# Altium project PCB.PrjPcb
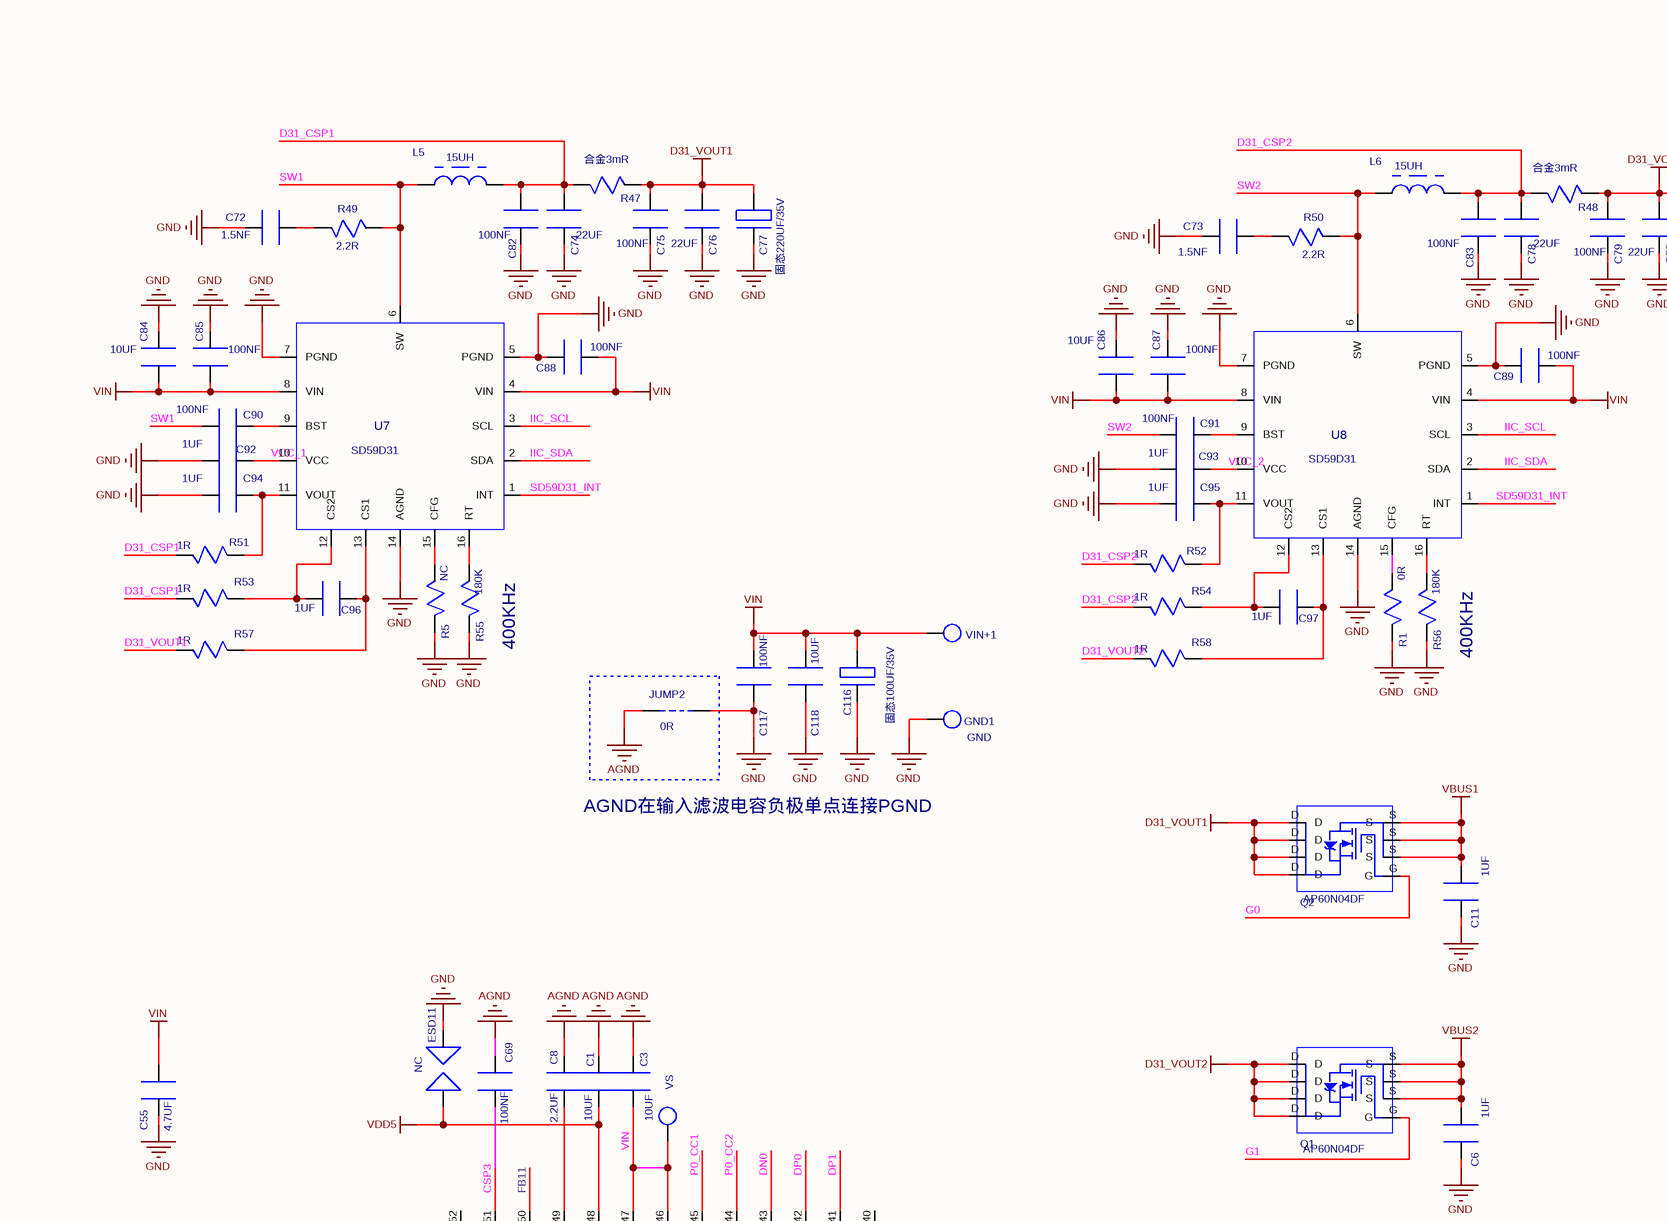
[diagram p0: K210-01-(B049) 3C1A-140W(SD3934+SD59D31+SD59D31+SP1232FL) 外挂FTF屏1.3寸-V3.SchDoc, top left]
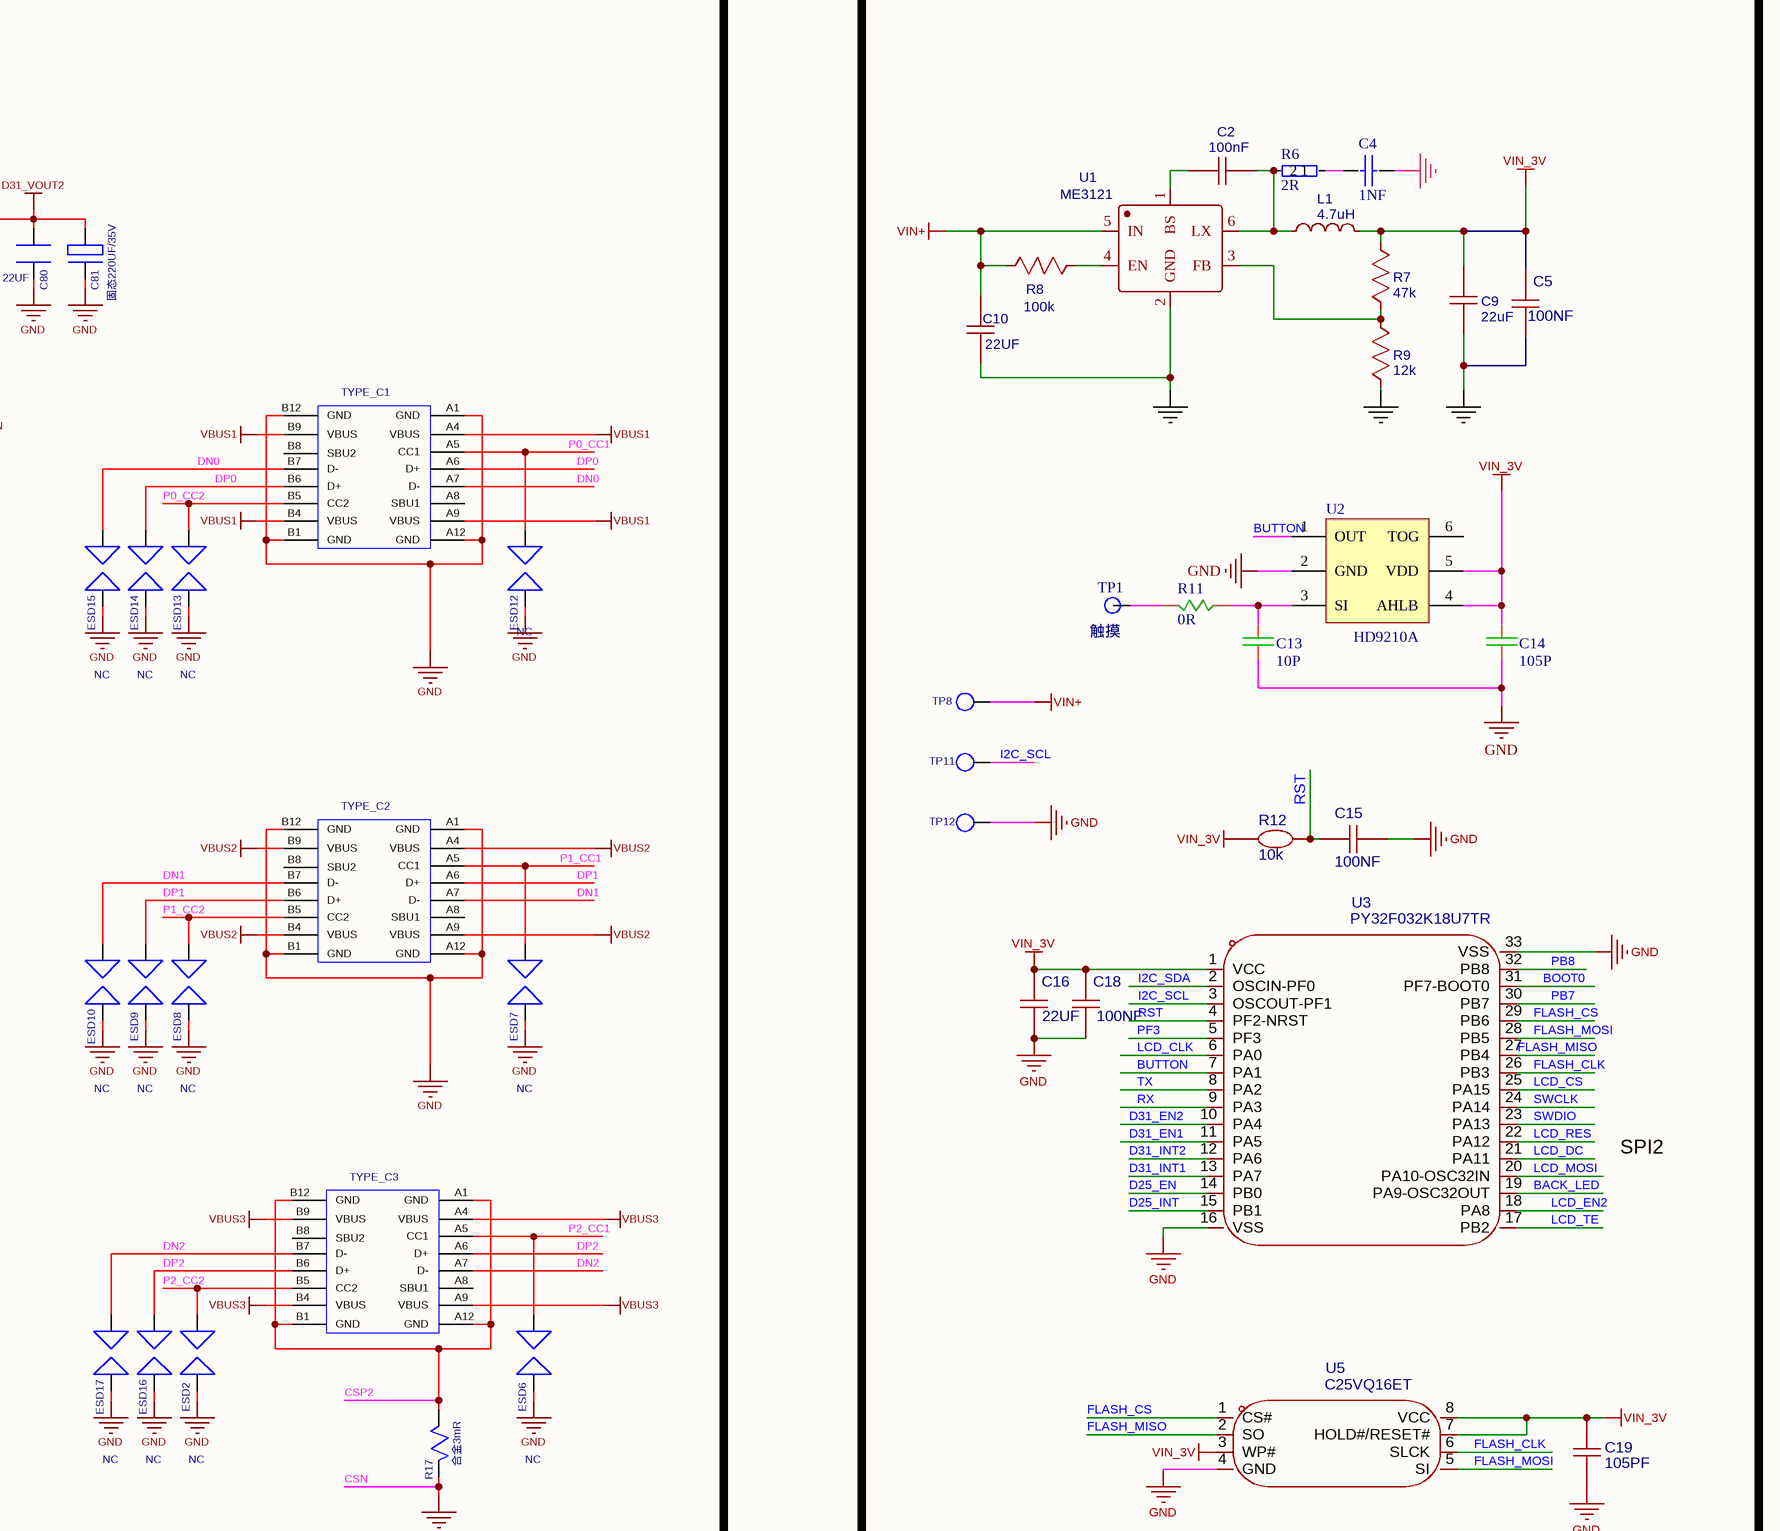
[diagram p1: K210-01-(B049) 3C1A-140W(SD3934+SD59D31+SD59D31+SP1232FL) 外挂FTF屏1.3寸-V3.SchDoc, top right]
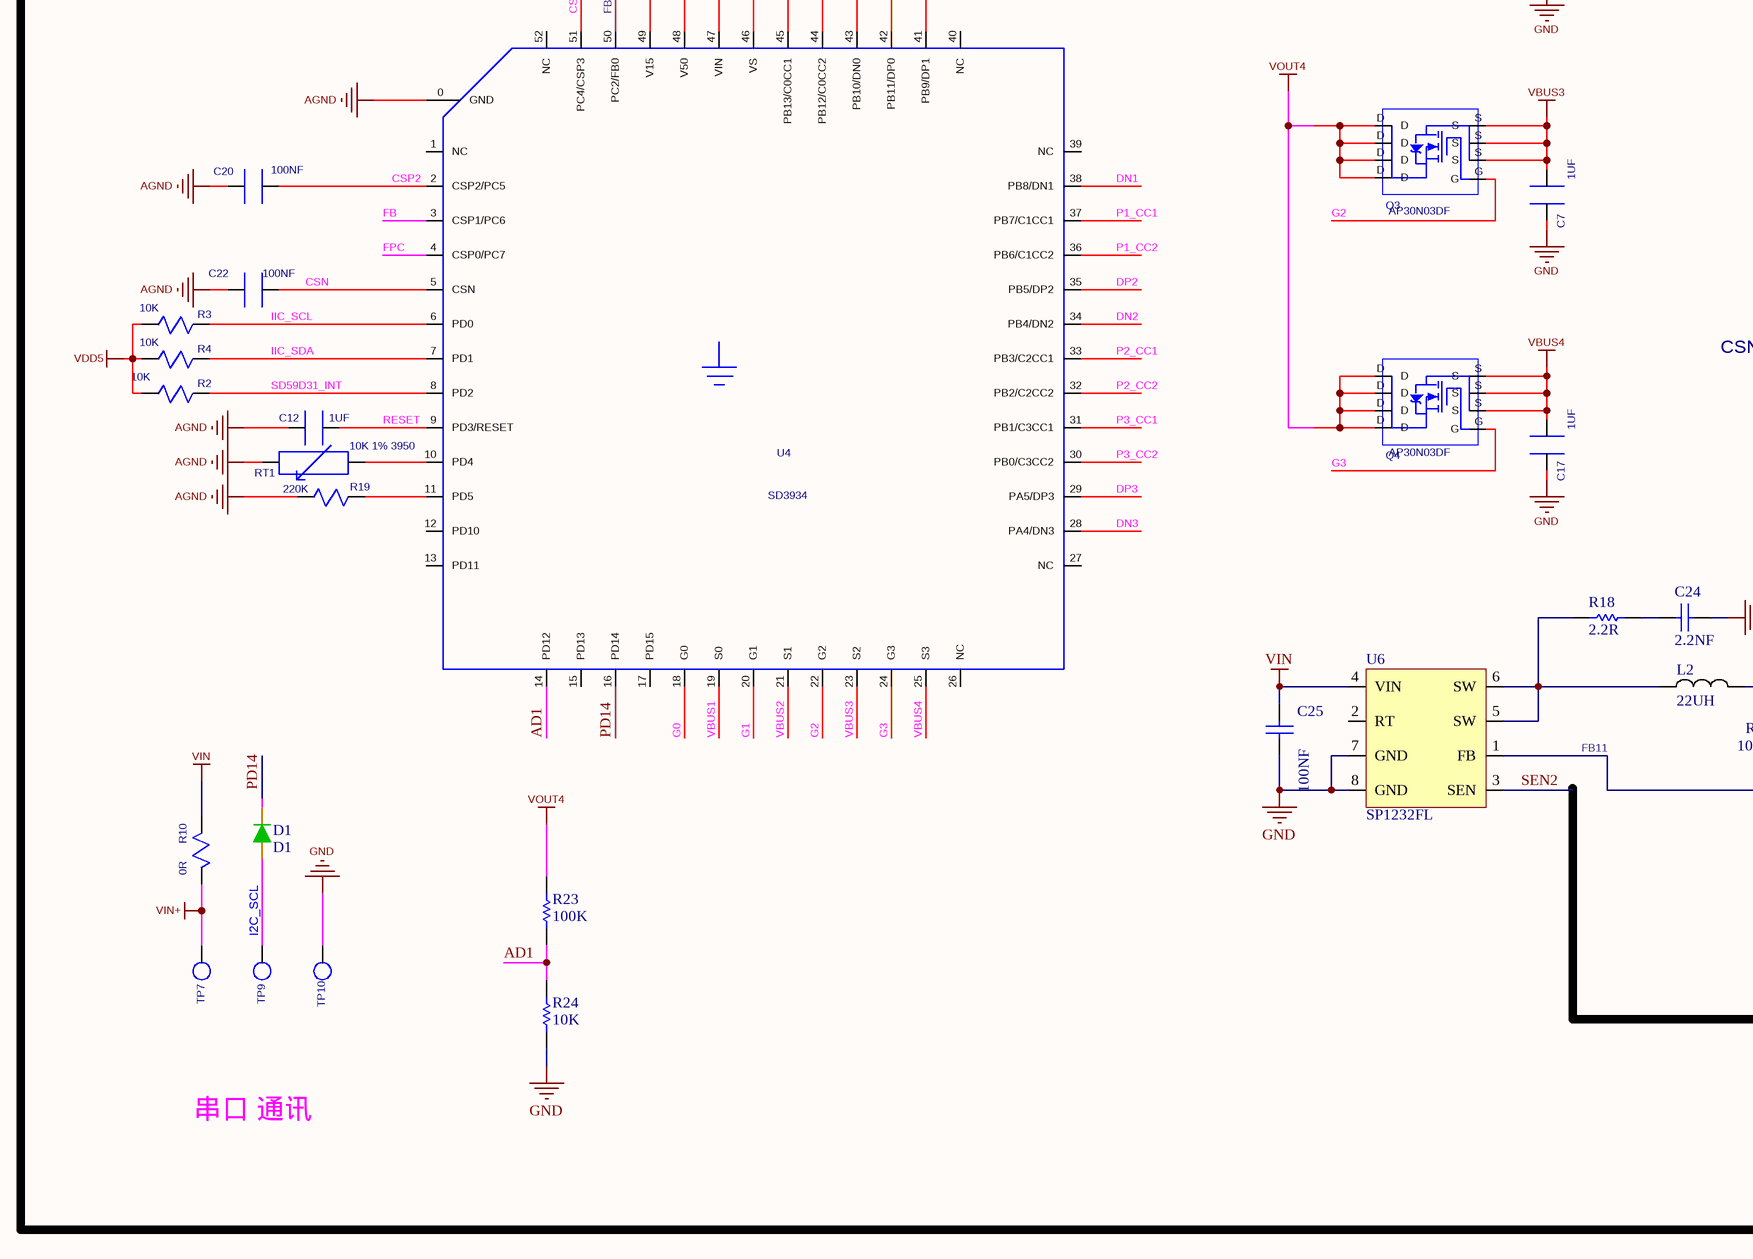
[diagram p2: K210-01-(B049) 3C1A-140W(SD3934+SD59D31+SD59D31+SP1232FL) 外挂FTF屏1.3寸-V3.SchDoc, bottom left]
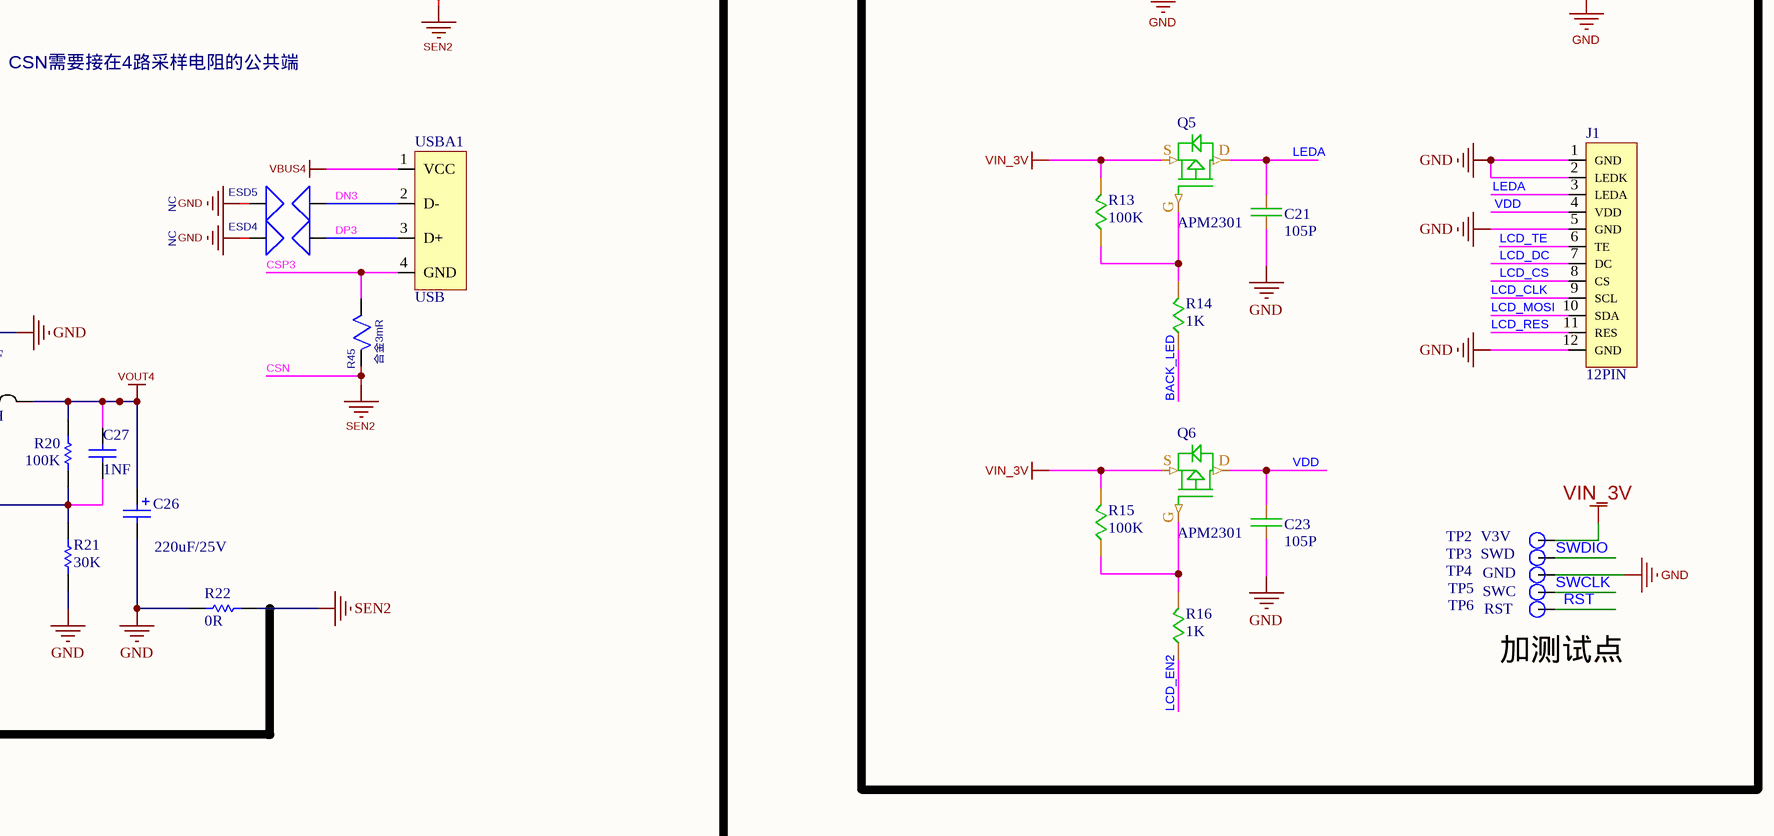
[diagram p3: K210-01-(B049) 3C1A-140W(SD3934+SD59D31+SD59D31+SP1232FL) 外挂FTF屏1.3寸-V3.SchDoc, bottom right]
1 sheet, 151 parts. Net scope: global (net labels, ports and power ports of the same name join across sheets).
Board files: K210-01-(B049) 3C1A-140W-显示屏板-V3-显示板.PcbDoc, K210-01-(B049) 3C1A-140W(SD3934+SD59D31+SD59D31+SP1232FL) 外挂FTF屏1.3寸-V3-协议板.PcbDoc

## Sheet K210-01-(B049) 3C1A-140W(SD3934+SD59D31+SD59D31+SP1232FL) 外挂FTF屏1.3寸-V3.SchDoc
size A2; DrawnBy: Henry Zhong; Organization: SILAN MICROELECTRONICS CO.,LTD.; SheetNumber: 1; SheetTotal: 2

### Parts
C1  10UF  [C 0805_L]
C2  100nF  [C 0402_L]
C3  10UF  [C 0805_L]
C4  1NF  [C 0402_L]
C5  100NF  [C 0402_L]
C6  1UF  [C 0402_L]
C7  1UF  [C 0402_L]
C8  2.2UF  [C 0805_L]
C9  22uF  [C 0805_L]
C10  22UF  [C 0805_L]
C11  1UF  [C 0402_L]
C12  1UF  [C 0402_L]
C13  10P  [C 0402_L]
C14  105P  [C 0402_L]
C15  100NF  [C 0402_L]
C16  22UF  [C 0805_L]
C17  1UF  [C 0402_L]
C18  100NF  [C 0402_L]
C19  105PF  [C 0402_L]
C20  100NF  [C 0402_L]
C21  105P  [C 0402_L]
C22  100NF  [C 0402_L]
C23  105P  [C 0402_L]
C24  2.2NF  [C 0402_L]
C25  100NF  [C 0402_L]
C26  220uF/25V  [6*12W]
C27  1NF  [C 0402_L]
C55  4.7UF  [C 0805_L]
C69  100NF  [C 0402_L]
C72  1.5NF  [C 0402_L]
C73  1.5NF  [C 0402_L]
C74  22UF  [C 0805_L]
C75  100NF  [C 0402_L]
C76  22UF  [C 0805_L]
C77  固态220UF/35V  [6*12W]
C78  22UF  [C 0805_L]
C79  100NF  [C 0402_L]
C80  22UF  [C 0805_L]
C81  固态220UF/35V  [6*12W]
C82  100NF  [C 0402_L]
C83  100NF  [C 0402_L]
C84  10UF  [C 0805_L]
C85  100NF  [C 0402_L]
C86  10UF  [C 0805_L]
C87  100NF  [C 0402_L]
C88  100NF  [C 0402_L]
C89  100NF  [C 0402_L]
C90  100NF  [C 0402_L]
C91  100NF  [C 0402_L]
C92  1UF  [C 0402_L]
C93  1UF  [C 0402_L]
C94  1UF  [C 0402_L]
C95  1UF  [C 0402_L]
C96  1UF  [C 0402_L]
C97  1UF  [C 0402_L]
C116  固态100UF/35V  [6*12W]
C117  100NF  [C 0402_L]
C118  10UF  [C 0805_L]
D1  D1  [SOD-323]
ESD2  NC  [SOD-323]
ESD4  NC  [SOD-323]
ESD5  NC  [SOD-323]
ESD6  NC  [SOD-323]
ESD7  NC  [SOD-323]
ESD8  NC  [SOD-323]
ESD9  NC  [SOD-323]
ESD10  NC  [SOD-323]
ESD11  NC  [SOD-323]
ESD12  NC  [SOD-323]
ESD13  NC  [SOD-323]
ESD14  NC  [SOD-323]
ESD15  NC  [SOD-323]
ESD16  NC  [SOD-323]
ESD17  NC  [SOD-323]
GND1  value GND  [焊盘1.5mm]  (hidden comment: TEST)
J1  12PIN  [TFT-0.5-12PIN上接]
JUMP2  0R  [R 0805_L]
L1  4.7uH  [CD32]
L2  22UH  [040125]
L5  15UH  [050125]
L6  15UH  [050125]
Q1  AP60N04DF  [DFN3*3]
Q2  AP60N04DF  [DFN3*3]
Q3  AP30N03DF  [DFN3*3]
Q4  AP30N03DF  [DFN3*3]
Q5  APM2301  [SOT23-MOS]
Q6  APM2301  [SOT23-MOS]
R1  0R  [R 0402_L]
R2  10K  [R 0402_L]
R3  10K  [R 0402_L]
R4  10K  [R 0402_L]
R5  NC  [R 0402_L]
R6  2R  [R 0402_L]
R7  47k  [R 0402_L]
R8  100k  [R 0402_L]
R9  12k  [R 0402_L]
R10  0R  [R 0805_L]
R11  0R  [R 0402_L]
R12  10k  [R 0402_L]
R13  100K  [R 0402_L]
R14  1K  [R 0402_L]
R15  100K  [R 0402_L]
R16  1K  [R 0402_L]
R17  合金3mR  [R 1206_L]
R18  2.2R  [R 0402_L]
R19  220K  [R 0402_L]
R20  100K  [R 0402_L]
R21  30K  [R 0402_L]
R22  0R  [R 1206_L]
R23  100K  [R 0402_L]
R24  10K  [R 0402_L]
R45  合金3mR  [R 1206_L]
R47  合金3mR  [R 1206_L]
R48  合金3mR  [R 1206_L]
R49  2.2R  [R 0402_L]
R50  2.2R  [R 0402_L]
R51  1R  [R 0402_L]
R52  1R  [R 0402_L]
R53  1R  [R 0402_L]
R54  1R  [R 0402_L]
R55  180K  [R 0402_L]
R56  180K  [R 0402_L]
R57  1R  [R 0402_L]
R58  1R  [R 0402_L]
RT1  10K 1% 3950  [NTC1]
TP1  触摸  [焊盘1.5mm]
TP2  V3V  [焊盘1.5*2.5mm]
TP3  SWD  [焊盘1.5*2.5mm]
TP4  GND  [焊盘1.5*2.5mm]
TP5  SWC  [焊盘1.5*2.5mm]
TP6  RST  [焊盘1.5*2.5mm]
TP7  TEST  [焊盘椭圆]  (value not drawn)
TP8  TEST  [焊盘椭圆]  (value not drawn)
TP9  TEST  [焊盘椭圆]  (value not drawn)
TP10  TEST  [焊盘椭圆]  (value not drawn)
TP11  TEST  [焊盘椭圆]  (value not drawn)
TP12  TEST  [焊盘椭圆]  (value not drawn)
TYPE_C1  TYPEC_1  [TP-14pin 180°]  (value not drawn)
TYPE_C2  TYPEC_1  [TP-14pin 180°]  (value not drawn)
TYPE_C3  TYPEC_1  [TP-14pin 180°]  (value not drawn)
U1  ME3121  [SOT23-6]
U2  HD9210A  [SOT23-6]
U3  PY32F032K18U7TR  [QFN32 4*4]
U4  SD3934  [QFN52L6*6]
U5  C25VQ16ET  [SOP8]
U6  SP1232FL  [SOP8]
U7  SD59D31  [SD59D31_QFN16]
U8  SD59D31  [SD59D31_QFN16]
USBA1  USB  [USB180 10mm]
VIN+1  TEST  [焊盘1.5mm]  (value not drawn)
VS  TEST  [焊盘1.5mm]  (value not drawn)

### Blocks framed on the sheet
串口 通讯: C1 C3 C6-C8 C11 C12 C17 C20 C22 C24-C27 C55 C69 C72-C97 C116-C118 D1 ESD2 ESD4-ESD17 GND1 JUMP2 L2 L5 L6 Q1-Q4 R1-R5 R10 R17-R24 R45 R47-R58 RT1 TP7 TP9 TP10 TYPE_C1-TYPE_C3 U4 U6-U8 USBA1 VIN+1 VS
加测试点: C2 C4 C5 C9 C10 C13-C16 C18 C19 C21 C23 J1 L1 Q5 Q6 R6-R9 R11-R16 TP1-TP6 TP8 TP11 TP12 U1-U3 U5

### Nets
AGND: C1.1 C3.1 C8.1 C12.1 C20.2 C22.2 C69.2 JUMP2.1 R19.1 RT1.2 U4.0(GND)
CSN: C22.1 R17.2 R22.2 R45.2 U4.5(CSN) U6.3(SEN)  [also labelled SEN2]
D31_VOUT1: C75.2 C76.2 C77.1 Q2.D R47.1 R57.1
D31_VOUT2: C79.2 C80.2 C81.1 Q1.D R48.1 R58.1
GND: C4.1 C5.1 C6.1 C7.1 C9.1 C10.2 C11.1 C13.1 C14.2 C15.1 C16.1 C17.1 C18.1 C19.2 C21.1 C23.1 C24.1 C25.1 C26.2 C55.2 C72.1 C73.1 C74.1 C75.1 C76.1 C77.2 C78.1 C79.1 C80.1 C81.2 C82.1 C83.1 C84.1 C85.1 C86.1 C87.1 C88.1 C89.1 C92.2 C93.2 C94.2 C95.2 C116.2 C117.1 C118.1 ESD2.1 ESD4.1 ESD5.1 ESD6.1 ESD7.1 ESD8.1 ESD9.1 ESD10.1 ESD11.1 ESD12.1 ESD13.1 ESD14.1 ESD15.1 ESD16.1 ESD17.1 GND1.1 J1.1(GND) J1.2(LEDK) J1.5(GND) J1.12(GND) JUMP2.2 R1.2 R5.2 R9.1 R21.2 R22.1 R24.2 R55.2 R56.2 TP4.1 TP10.1 TP12.1 TYPE_C1.A1(GND) TYPE_C1.A12(GND) TYPE_C1.B1(GND) TYPE_C1.B12(GND) TYPE_C2.A1(GND) TYPE_C2.A12(GND) TYPE_C2.B1(GND) TYPE_C2.B12(GND) U1.2(GND) U2.2(GND) U3.16(VSS) U3.33(VSS) U5.4(GND) U6.7(GND) U6.8(GND) U7.5(PGND) U7.7(PGND) U7.14(AGND) U8.5(PGND) U8.7(PGND) U8.14(AGND)
VBUS1: C11.2 Q2.S TYPE_C1.A4(VBUS) TYPE_C1.A9(VBUS) TYPE_C1.B4(VBUS) TYPE_C1.B9(VBUS) U4.19(S0)
VBUS2: C6.2 Q1.S TYPE_C2.A4(VBUS) TYPE_C2.A9(VBUS) TYPE_C2.B4(VBUS) TYPE_C2.B9(VBUS) U4.21(S1)
VBUS3: C7.2 Q3.S TYPE_C3.A4(VBUS) TYPE_C3.A9(VBUS) TYPE_C3.B4(VBUS) TYPE_C3.B9(VBUS) U4.23(S2)
VBUS4: C17.2 Q4.S U4.25(S3) USBA1.1(VCC)
VDD5: C1.2 ESD11.2 R2.1 R3.1 R4.1 U4.48(V50)
VIN: C3.2 C25.2 C55.1 C84.2 C85.2 C86.2 C87.2 C88.2 C89.2 C116.1 C117.2 C118.2 R10.2 U4.46(VS) U4.47(VIN) U6.4(VIN) U7.4(VIN) U7.8(VIN) U8.4(VIN) U8.8(VIN) VIN+1.1 VS.1
VIN+: C10.1 R8.2 R10.1 TP7.1 TP8.1 U1.5(IN)
VIN_3V: C5.2 C9.2 C14.1 C16.2 C18.2 C19.1 L1.2 Q5.S Q6.S R7.2 R12.2 R13.2 R15.2 TP2.1 U2.4(AHLB) U2.5(VDD) U3.1(VCC) U5.3(WP#) U5.7(HOLD#/RESET#) U5.8(VCC)
VOUT4: C26.1 C27.1 L2.2 Q3.D Q4.D R20.2 R23.2
AD1: R23.1 R24.1 U4.14(PD12)
BACK_LED: R14.1 U3.19(PA9-OSC32OUT)
BOOT0: U3.31(PF7-BOOT0)
BUTTON: U2.1(OUT) U3.7(PA1)
CSP2: C20.1 R17.1 TYPE_C3.A1(GND) TYPE_C3.A12(GND) TYPE_C3.B1(GND) TYPE_C3.B12(GND) U4.2(CSP2/PC5)
CSP3: C69.1 R45.1 U4.51(PC4/CSP3) USBA1.4(GND)
D25_EN: U3.14(PB0)
D25_INT: U3.15(PB1)
D31_CSP1: C74.2 C82.2 L5.2 R47.2 R51.1 R53.1
D31_CSP2: C78.2 C83.2 L6.2 R48.2 R52.1 R54.1
D31_EN1: U3.11(PA5)
D31_EN2: U3.10(PA4)
D31_INT1: U3.13(PA7)
D31_INT2: U3.12(PA6)
DN0: ESD15.2 TYPE_C1.A7(D-) TYPE_C1.B7(D-) U4.43(PB10/DN0)
DN1: ESD10.2 TYPE_C2.A7(D-) TYPE_C2.B7(D-) U4.38(PB8/DN1)
DN2: ESD17.2 TYPE_C3.A7(D-) TYPE_C3.B7(D-) U4.34(PB4/DN2)
DN3: ESD5.2 U4.28(PA4/DN3) USBA1.2(D-)
DP0: ESD14.2 TYPE_C1.A6(D+) TYPE_C1.B6(D+) U4.42(PB11/DP0)
DP1: ESD9.2 TYPE_C2.A6(D+) TYPE_C2.B6(D+) U4.41(PB9/DP1)
DP2: ESD16.2 TYPE_C3.A6(D+) TYPE_C3.B6(D+) U4.35(PB5/DP2)
DP3: ESD4.2 U4.29(PA5/DP3) USBA1.3(D+)
FB: U4.3(CSP1/PC6)
FB11: C27.2 R20.1 R21.1 U4.50(PC2/FB0) U6.1(FB)
FLASH_CLK: U3.26(PB3) U5.6(SLCK)
FLASH_CS: U3.29(PB6) U5.1(CS#)
FLASH_MISO: U3.27(PB4) U5.2(SO)
FLASH_MOSI: U3.28(PB5) U5.5(SI)
FPC: U4.4(CSP0/PC7)
G0: Q2.G U4.18(G0)
G1: Q1.G U4.20(G1)
G2: Q3.G U4.22(G2)
G3: Q4.G U4.24(G3)
I2C_SCL: D1.1 TP9.1 TP11.1 U3.3(OSCOUT-PF1)
I2C_SDA: U3.2(OSCIN-PF0)
IIC_SCL: R3.2 U4.6(PD0) U7.3(SCL) U8.3(SCL)
IIC_SDA: R4.2 U4.7(PD1) U7.2(SDA) U8.2(SDA)
LCD_CLK: J1.9(SCL) U3.6(PA0)
LCD_CS: J1.8(CS) U3.25(PA15)
LCD_DC: J1.7(DC) U3.21(PA11)
LCD_EN2: R16.1 U3.18(PA8)
LCD_MOSI: J1.10(SDA) U3.20(PA10-OSC32IN)
LCD_RES: J1.11(RES) U3.22(PA12)
LCD_TE: J1.6(TE) U3.17(PB2)
LEDA: C21.2 J1.3(LEDA) Q5.D
P0_CC1: ESD12.2 TYPE_C1.A5(CC1) U4.45(PB13/C0CC1)
P0_CC2: ESD13.2 TYPE_C1.B5(CC2) U4.44(PB12/C0CC2)
P1_CC1: ESD7.2 TYPE_C2.A5(CC1) U4.37(PB7/C1CC1)
P1_CC2: ESD8.2 TYPE_C2.B5(CC2) U4.36(PB6/C1CC2)
P2_CC1: ESD6.2 TYPE_C3.A5(CC1) U4.33(PB3/C2CC1)
P2_CC2: ESD2.2 TYPE_C3.B5(CC2) U4.32(PB2/C2CC2)
P3_CC1: U4.31(PB1/C3CC1)
P3_CC2: U4.30(PB0/C3CC2)
PB7: U3.30(PB7)
PB8: U3.32(PB8)
PD14: D1.2 U4.16(PD14)
PF3: U3.5(PF3)
RESET: C12.2 U4.9(PD3/RESET)
RST: C15.2 R12.1 TP6.1 U3.4(PF2-NRST)
RX: U3.9(PA3)
SD59D31_INT: R2.2 U4.8(PD2) U7.1(INT) U8.1(INT)
SW1: C90.2 L5.1 R49.1 U7.6(SW)
SW2: C91.2 L6.1 R50.1 U8.6(SW)
SWCLK: TP5.1 U3.24(PA14)
SWDIO: TP3.1 U3.23(PA13)
TX: U3.8(PA2)
VCC_1: C92.1 U7.10(VCC)
VCC_2: C93.1 U8.10(VCC)
VDD: C23.2 J1.4(VDD) Q6.D
NetC2_1: C2.1 L1.1 R6.2 U1.6(LX)
NetC2_2: C2.2 U1.1(BS)
NetC4_2: C4.2 R6.1
NetC8_2: C8.2 U4.49(V15)
NetC13_2: C13.2 R11.1 U2.3(SI)
NetC24_2: C24.2 R18.2
NetC72_2: C72.2 R49.2
NetC73_2: C73.2 R50.2
NetC90_1: C90.1 U7.9(BST)
NetC91_1: C91.1 U8.9(BST)
NetC94_1: C94.1 R51.2 U7.11(VOUT)
NetC95_1: C95.1 R52.2 U8.11(VOUT)
NetC96_1: C96.1 R57.2 U7.13(CS1)
NetC96_2: C96.2 R53.2 U7.12(CS2)
NetC97_1: C97.1 R58.2 U8.13(CS1)
NetC97_2: C97.2 R54.2 U8.12(CS2)
NetL2_1: L2.1 R18.1 U6.5(SW) U6.6(SW)
NetQ5_G: Q5.G R13.1 R14.2
NetQ6_G: Q6.G R15.1 R16.2
NetR1_1: R1.1 U8.15(CFG)
NetR5_1: R5.1 U7.15(CFG)
NetR7_1: R7.1 R9.2 U1.3(FB)
NetR8_1: R8.1 U1.4(EN)
NetR11_2: R11.2 TP1.1
NetR19_2: R19.2 U4.11(PD5)
NetR55_1: R55.1 U7.16(RT)
NetR56_1: R56.1 U8.16(RT)
NetRT1_1: RT1.1 U4.10(PD4)

Not connected (* = marked no-connect by the designer): TYPE_C1 A8(SBU1) B8(SBU2); TYPE_C2 A8(SBU1) B8(SBU2); TYPE_C3 A8(SBU1) B8(SBU2); U2 6(TOG); U4 1(NC) 12(PD10) 13(PD11) 15(PD13) 17(PD15) 26(NC) 27(NC) 39(NC) 40(NC) 52(NC); U6 2(RT)

### Notes on the sheet
- (near R55) 400KHz
- (near R56) 400KHz
- AGND在输入滤波电容负极单点连接PGND
- SPI2
- CSN需要接在4路采样电阻的公共端

### Library data of the parts
C1 = C-CC: 贴片电容：10UF/10V-X5R-0805; PART DESC: CERAMIC CAP; PART NUMBER: 003-; PCB DECAL: CCV5S; TOLERANCE: +-??%; VOLTAGE RATING: ??V; Published: 8-Jun-2000; LatestRevisionDate: 17-Jul-2002; LatestRevisionNote: Re-released for DXP Platform.; PackageReference: RAD-0.3; Publisher: Altium Limited; PackageDescription: Radial Cap, Thru-Hole; 2 Leads; 0.3 in Pin Spacing
C2 = 22nF: 贴片电容：100NF/25V-X7R-0402; nameAlias: Value(F); Contributor: LCEDA_Lib; spicePre: C; spiceSymbolName: C_0603_US
C3 = C-CC: 贴片电容：10UF/50V-X5R-0805; PART DESC: CERAMIC CAP; PART NUMBER: 003-; PCB DECAL: CCV5S; TOLERANCE: +-??%; VOLTAGE RATING: ??V; Published: 8-Jun-2000; LatestRevisionDate: 17-Jul-2002; LatestRevisionNote: Re-released for DXP Platform.; PackageReference: RAD-0.3; Publisher: Altium Limited; PackageDescription: Radial Cap, Thru-Hole; 2 Leads; 0.3 in Pin Spacing
C4 = C0402: 贴片电容：1NF/50V-X7R-0402; PCB DECAL: 0402; Comment_1: C0402
C5 = 0.1u: 贴片电容：100NF/10V-X5R-0402; Convert to PCB: yes; UniqueId: ggeef7817906d228245; ModelId: ac9b32e974bc448eab36b1293f859dcb; ModelName: C0603_L1.6-W0.8-H0.8; ModelTransform: v2:[39.37007874015748,0,0,0,39.37007874015748,0,0,0,39.37007874015748,0.001,0,0]; Device: 0.1u; Add into BOM: yes; SymbolName: 0.1u; FootprintName: C0603
C6 C7 C11 C17 C96 C97 = C-CC: 贴片电容：1UF/50V-X7R-0402; PART DESC: CERAMIC CAP; PART NUMBER: 003-; PCB DECAL: CCV5S; TOLERANCE: +-??%; VOLTAGE RATING: ??V; Published: 8-Jun-2000; LatestRevisionDate: 17-Jul-2002; LatestRevisionNote: Re-released for DXP Platform.; PackageReference: RAD-0.3; Publisher: Altium Limited; PackageDescription: Radial Cap, Thru-Hole; 2 Leads; 0.3 in Pin Spacing
C8 = C-CC: 贴片电容：2.2UF/10V-X5R-0805; PART DESC: CERAMIC CAP; PART NUMBER: 003-; PCB DECAL: CCV5S; TOLERANCE: +-??%; VOLTAGE RATING: ??V; Published: 8-Jun-2000; LatestRevisionDate: 17-Jul-2002; LatestRevisionNote: Re-released for DXP Platform.; PackageReference: RAD-0.3; Publisher: Altium Limited; PackageDescription: Radial Cap, Thru-Hole; 2 Leads; 0.3 in Pin Spacing
C9 = 22uF: 贴片电容：22UF/10V-X7R-0805; nameAlias: Value(F); Contributor: LCEDA_Lib; spicePre: C; spiceSymbolName: C_0805_US
C10 = 10uF: 贴片电容：22UF/35V-X7R-0805; nameAlias: Value(F); Contributor: LCEDA_Lib; spicePre: C; spiceSymbolName: C_0603_US
C12 = C-CC: 贴片电容：1UF/50V-X7R-0402; PART DESC: CERAMIC CAP; PART NUMBER: 003-; TOLERANCE: +-??%; VOLTAGE RATING: ??V; PCB DECAL: CCV5S
C13 = CAP: 贴片电容：10P/10V-X5R-0402
C14 C21 C23 = CAP: 贴片电容：105P/10V-X5R-0402
C15 = 10uF: 贴片电容：100NF/10V-X7R-0805; Convert to PCB: yes; UniqueId: gge1e13a888c85ebaed; ModelId: ac9b32e974bc448eab36b1293f859dcb; ModelName: C0603_L1.6-W0.8-H0.8; ModelTransform: v2:[39.37007874015748,0,0,0,39.37007874015748,0,0,0,39.37007874015748,0.001,0,0]; Device: 10uF; Add into BOM: yes; SymbolName: 10uF; FootprintName: C0603
C16 = 10uF: 贴片电容：22UF/10V-X7R-0805; Convert to PCB: yes; UniqueId: gge2649e10512dd5dd7; ModelId: ac9b32e974bc448eab36b1293f859dcb; ModelName: C0603_L1.6-W0.8-H0.8; ModelTransform: v2:[39.37007874015748,0,0,0,39.37007874015748,0,0,0,39.37007874015748,0.001,0,0]; Device: 10uF; Add into BOM: yes; SymbolName: 10uF; FootprintName: C0603
C18 = 0.1u: 贴片电容：100NF/10V-X5R-0402; Convert to PCB: yes; UniqueId: gge4f251fc7ae9908d9; ModelId: ac9b32e974bc448eab36b1293f859dcb; ModelName: C0603_L1.6-W0.8-H0.8; ModelTransform: v2:[39.37007874015748,0,0,0,39.37007874015748,0,0,0,39.37007874015748,0.001,0,0]; Device: 0.1u; Add into BOM: yes; SymbolName: 0.1u; FootprintName: C0603
C19 = 0.1u: 贴片电容：105P/10V-X5R-0402; Convert to PCB: yes; UniqueId: ggeeecb535e2993774a; ModelId: ac9b32e974bc448eab36b1293f859dcb; ModelName: C0603_L1.6-W0.8-H0.8; ModelTransform: v2:[39.37007874015748,0,0,0,39.37007874015748,0,0,0,39.37007874015748,0.001,0,0]; Device: 0.1u; Add into BOM: yes; SymbolName: 0.1u; FootprintName: C0603
C20 C22 C69 C85 C87-C91 = C-CC: 贴片电容：100NF/50V-X7R-0402; PART DESC: CERAMIC CAP; PART NUMBER: 003-; PCB DECAL: CCV5S; TOLERANCE: +-??%; VOLTAGE RATING: ??V; Published: 8-Jun-2000; LatestRevisionDate: 17-Jul-2002; LatestRevisionNote: Re-released for DXP Platform.; PackageReference: RAD-0.3; Publisher: Altium Limited; PackageDescription: Radial Cap, Thru-Hole; 2 Leads; 0.3 in Pin Spacing
C24 = Cap: 贴片电容：2.2NF/50V-X7R-0402; Published: 8-Jun-2000; LatestRevisionDate: 17-Jul-2002; LatestRevisionNote: Re-released for DXP Platform.; PackageReference: RAD-0.3; Publisher: Altium Limited; PackageDescription: Radial Cap, Thru-Hole; 2 Leads; 0.3 in Pin Spacing
C25 = Cap: 贴片电容：100NF/50V-X7R-0402; Published: 8-Jun-2000; LatestRevisionDate: 17-Jul-2002; LatestRevisionNote: Re-released for DXP Platform.; PackageReference: RAD-0.3; Publisher: Altium Limited; PackageDescription: Radial Cap, Thru-Hole; 2 Leads; 0.3 in Pin Spacing
C26 = Cap Pol2: 电解电容：220UF/25V 6.3*8mm; Published: 8-Jun-2000; LatestRevisionDate: 17-Jul-2002; LatestRevisionNote: Re-released for DXP Platform.; PackageReference: POLAR0.8; Publisher: Altium Limited; PackageDescription: Polarized Capacitor; 2 Leads
C27 = Cap: 贴片电容：1NF/50V-X7R-0402; Published: 8-Jun-2000; LatestRevisionDate: 17-Jul-2002; LatestRevisionNote: Re-released for DXP Platform.; PackageReference: RAD-0.3; Publisher: Altium Limited; PackageDescription: Radial Cap, Thru-Hole; 2 Leads; 0.3 in Pin Spacing
C55 = C-CC: 贴片电容：4.7UF/25V-X5R-0805; PART DESC: CERAMIC CAP; PART NUMBER: 003-; PCB DECAL: CCV5S; TOLERANCE: +-??%; VOLTAGE RATING: ??V; Published: 8-Jun-2000; LatestRevisionDate: 17-Jul-2002; LatestRevisionNote: Re-released for DXP Platform.; PackageReference: RAD-0.3; Publisher: Altium Limited; PackageDescription: Radial Cap, Thru-Hole; 2 Leads; 0.3 in Pin Spacing
C72 C73 = C-CC: 贴片电容：1.5NF/50V-X7R-0402; PART DESC: CERAMIC CAP; PART NUMBER: 003-; TOLERANCE: +-??%; VOLTAGE RATING: ??V; PCB DECAL: CCV5S
C74 C76 C78 C80 = C-CC: 22UF/25V-X5R-0805; PART DESC: CERAMIC CAP; PART NUMBER: 003-; PCB DECAL: CCV5S; TOLERANCE: +-??%; VOLTAGE RATING: ??V; Published: 8-Jun-2000; LatestRevisionDate: 17-Jul-2002; LatestRevisionNote: Re-released for DXP Platform.; PackageReference: RAD-0.3; Publisher: Altium Limited; PackageDescription: Radial Cap, Thru-Hole; 2 Leads; 0.3 in Pin Spacing
C75 C79 C82 C83 = C-CC: 贴片电容：100NF/25V-X7R-0402; PART DESC: CERAMIC CAP; PART NUMBER: 003-; PCB DECAL: CCV5S; TOLERANCE: +-??%; VOLTAGE RATING: ??V; Published: 8-Jun-2000; LatestRevisionDate: 17-Jul-2002; LatestRevisionNote: Re-released for DXP Platform.; PackageReference: RAD-0.3; Publisher: Altium Limited; PackageDescription: Radial Cap, Thru-Hole; 2 Leads; 0.3 in Pin Spacing
C77 C81 = C-CE: 插件固态电容：220UF/35V -6*12; PCB DECAL: CE6X11
C84 C86 = C-CC: 贴片电容：10UF/25V-X7R-0805; PART DESC: CERAMIC CAP; PART NUMBER: 003-; PCB DECAL: CCV5S; TOLERANCE: +-??%; VOLTAGE RATING: ??V; Published: 8-Jun-2000; LatestRevisionDate: 17-Jul-2002; LatestRevisionNote: Re-released for DXP Platform.; PackageReference: RAD-0.3; Publisher: Altium Limited; PackageDescription: Radial Cap, Thru-Hole; 2 Leads; 0.3 in Pin Spacing
C92 C93 = C-CC: 贴片电容：1UF/10V-X7R-0402; PART DESC: CERAMIC CAP; PART NUMBER: 003-; PCB DECAL: CCV5S; TOLERANCE: +-??%; VOLTAGE RATING: ??V; Published: 8-Jun-2000; LatestRevisionDate: 17-Jul-2002; LatestRevisionNote: Re-released for DXP Platform.; PackageReference: RAD-0.3; Publisher: Altium Limited; PackageDescription: Radial Cap, Thru-Hole; 2 Leads; 0.3 in Pin Spacing
C94 C95 = C-CC: 贴片电容：1UF/25V-X7R-0402; PART DESC: CERAMIC CAP; PART NUMBER: 003-; PCB DECAL: CCV5S; TOLERANCE: +-??%; VOLTAGE RATING: ??V; Published: 8-Jun-2000; LatestRevisionDate: 17-Jul-2002; LatestRevisionNote: Re-released for DXP Platform.; PackageReference: RAD-0.3; Publisher: Altium Limited; PackageDescription: Radial Cap, Thru-Hole; 2 Leads; 0.3 in Pin Spacing
C116 = C-CE: 插件固态电容：100UF/35V -6*12; PCB DECAL: CE6X11
C117 = C-CC: 贴片电容：100NF/50V-X7R-0402; PART DESC: CERAMIC CAP; PART NUMBER: 003-; TOLERANCE: +-??%; VOLTAGE RATING: ??V; PCB DECAL: CCV5S
C118 = C-CC: 贴片电容：10UF/50V-X7R-0805; PART DESC: CERAMIC CAP; PART NUMBER: 003-; TOLERANCE: +-??%; VOLTAGE RATING: ??V; PCB DECAL: CCV5S
ESD2 ESD6 ESD11 ESD16 ESD17 = ESD1: PCB DECAL: 0603-CAP
ESD4 ESD5 ESD7-ESD10 ESD12-ESD15 = ESD1: PCB DECAL: DIODE\SMD
GND1 TP7-TP12 VIN+1 VS = TEST: PCB DECAL: TPSM
  VS: VALUE: TEST
J1 = 12PIN: TFT贴片座：TFT-0.5-12PIN
JUMP2 = J: 贴片电阻：0R-0805-F; PCB DECAL: JP5
L1 = 4.7uH: 贴片电感：0420-4.7UH; Manufacturer: Sunlord; Manufacturer Part: MPH252012S4R7MT; nameAlias: Inductance; Supplier: LCSC; Supplier Part: C90256; spicePre: L; spiceSymbolName: MPH252012S4R7MT
L2 = L: 磁环电感：040125 22UH 0.7线径 立式加套管
L5 L6 = IND-UPRIGHT: 磁环电感：050125-15UH-1.2线径卧套; Code_IEC: 1005; PCB DECAL: FC5T5A; Published: 8-Jun-2000; LatestRevisionDate: 29-May-2009; LatestRevisionNote: IPC-7351 Footprint Added.; PackageReference: 0402-A; Publisher: Altium Limited; PackageDescription: Chip Inductor; Code_JEITA: 0402
Q1 Q2 = NMOS: 贴片MOS:AP60N04DF-3*3; PCB DECAL: DFN5_6
Q3 Q4 = NMOS: 贴片MOS:AP30N03DF-3*3; PCB DECAL: DFN5_6
Q5 Q6 = MOS_P: 贴片MOS：APM2301-SOT23-3
R1 = RES: 贴片电阻：0R-0402-F; Manufacturer: Generic Components; Class: Passive; SubClass: Resistor; PCB DECAL: 0603-RES; Published: 08/06/2000; Publisher: Altium Hobart Technology Centre
R2-R4 = RES: 贴片电阻：10K-0402-F; Manufacturer: Generic Components; Class: Passive; SubClass: Resistor; PCB DECAL: 0603-RES; Published: 08/06/2000; Publisher: Altium Hobart Technology Centre
R5 = RES: Manufacturer: Generic Components; Class: Passive; SubClass: Resistor; PCB DECAL: 0603-RES; Published: 08/06/2000; Publisher: Altium Hobart Technology Centre
R6 = R0402: 贴片电阻：2R-0402-F; PCB DECAL: 0402; Comment_1: R0402
R7 = 75k: 贴片电阻：47K-0402-1%; nameAlias: Value(Ω); Contributor: LCEDA_Lib; spicePre: R; spiceSymbolName: R_0603_US
R8 = 100k: 贴片电阻：100K-0402-1%; nameAlias: Value(Ω); Contributor: LCEDA_Lib; spicePre: R; spiceSymbolName: R_0603_US
R9 = 10k: 贴片电阻：12K-0402-1%; nameAlias: Value(Ω); Contributor: LCEDA_Lib; spicePre: R; spiceSymbolName: R_0603_US
R10 = RES: 贴片电阻：0R-0805-F; Manufacturer: Generic Components; Class: Passive; SubClass: Resistor; PCB DECAL: 0603-RES; Published: 08/06/2000; Publisher: Altium Hobart Technology Centre
R11 = R: 贴片电阻：0R-0402-F
R12 = 10k: 贴片电阻：10K-0402-F; Convert to PCB: yes; UniqueId: gged69dc30bc6f01ca4; ModelId: 6bd5cd867e9542ebae21caaf5d2d4c4d; ModelName: R0603; ModelTransform: v2:[2.410722045565656e-15,39.37007874015748,0,-39.37007874015748,2.410722045565656e-15,0,0,0,39.37007874015748,0,0,0]; Device: 10k; Add into BOM: yes; SymbolName: 10k; FootprintName: R0603
R13 R15 = R: 贴片电阻：100K-0402-F
R14 R16 = R: 贴片电阻：1K-0402-F
R17 R45 R47 R48 = RES: 贴片合金电阻：3mR-1206-F; Manufacturer: Generic Components; Class: Passive; SubClass: Resistor; PCB DECAL: 0603-RES; Published: 08/06/2000; Publisher: Altium Hobart Technology Centre
R18 = Res1: 贴片电阻：2.2R-0402-F; Published: 8-Jun-2000; LatestRevisionDate: 17-Jul-2002; LatestRevisionNote: Re-released for DXP Platform.; PackageReference: AXIAL-0.3; Publisher: Altium Limited; PackageDescription: Axial Device, Thru-Hole; 2 Leads; 0.3 in Pin Spacing
R19 = RES: 贴片电阻：220K-0402-F; Manufacturer: Generic Components; Class: Passive; SubClass: Resistor; PCB DECAL: 0603-RES; Published: 08/06/2000; Publisher: Altium Hobart Technology Centre
R20 R23 = Res1: 贴片电阻：100K-0402-F; Published: 8-Jun-2000; LatestRevisionDate: 17-Jul-2002; LatestRevisionNote: Re-released for DXP Platform.; PackageReference: AXIAL-0.3; Publisher: Altium Limited; PackageDescription: Axial Device, Thru-Hole; 2 Leads; 0.3 in Pin Spacing
R21 = Res1: 贴片电阻：30K-0402-F; Published: 8-Jun-2000; LatestRevisionDate: 17-Jul-2002; LatestRevisionNote: Re-released for DXP Platform.; PackageReference: AXIAL-0.3; Publisher: Altium Limited; PackageDescription: Axial Device, Thru-Hole; 2 Leads; 0.3 in Pin Spacing
R22 = Res1: 贴片合金电阻:0R-1206-F; Published: 8-Jun-2000; LatestRevisionDate: 17-Jul-2002; LatestRevisionNote: Re-released for DXP Platform.; PackageReference: AXIAL-0.3; Publisher: Altium Limited; PackageDescription: Axial Device, Thru-Hole; 2 Leads; 0.3 in Pin Spacing
R24 = Res1: 贴片电阻：10K-0402-F; Published: 8-Jun-2000; LatestRevisionDate: 17-Jul-2002; LatestRevisionNote: Re-released for DXP Platform.; PackageReference: AXIAL-0.3; Publisher: Altium Limited; PackageDescription: Axial Device, Thru-Hole; 2 Leads; 0.3 in Pin Spacing
R49 R50 = RES: 贴片电阻：2.2R-0402-F; Manufacturer: Generic Components; Class: Passive; SubClass: Resistor; PCB DECAL: 0603-RES; Published: 08/06/2000; Publisher: Altium Hobart Technology Centre
R51-R54 R57 R58 = RES: 贴片电阻：1R-0402,+/-1% SMD; Manufacturer: Generic Components; Class: Passive; SubClass: Resistor; PCB DECAL: 0603-RES; Published: 08/06/2000; Publisher: Altium Hobart Technology Centre
R55 R56 = RES: 贴片电阻：180K-0402-F; Manufacturer: Generic Components; Class: Passive; SubClass: Resistor; PCB DECAL: 0603-RES; Published: 08/06/2000; Publisher: Altium Hobart Technology Centre
RT1 = RES-A: 插件NTC热敏电阻：10K 1% 3950 L：60mm; PCB DECAL: R.AI-6\1(1/8W)
TP1-TP6 = TP
TYPE_C1-TYPE_C3 = TYPEC_1: PCB DECAL: TYPEC
U1 = TD8113: 贴片IC：ME3121-SOT23-6; Manufacturer: TMI; Manufacturer Part: STI3470; Contributor: wwjlisa; SMT Type: Extend; Supplier: LCSC; Supplier Part: C478938; LCSC Assembly: Yes; link: unknown; spicePre: U; spiceSymbolName: STI3470
U2 = SOT23-MCU: 贴片触摸：HD9210A-SOT23-6
U3 = PY32F031: 贴片IC：PY32F032K18U7TR-QFN32-4*4; Manufacturer: PUYA(普冉); Manufacturer Part: PY32F030K28U6TR; Convert to PCB: yes; UniqueId: gge62ac414b3116667d; ModelId: 595304ab79a843bfa03bdaf869386976; ModelName: QFN-32_L5.0-W5.0-H1.0-P0.50-TL-EP3.5; ModelTransform: v2:[39.37007874015748,0,0,0,39.37007874015748,0,0,0,39.37007874015748,0.001,0,0]; Device: PY32F031; Supplier: LCSC; Supplier Part: C3018718; JLCPCB Part Class: Extended Part; Add into BOM: yes; SymbolName: PY32F031; FootprintName: QFN-32_L5.0-W5.0-P0.50-TL-EP3.5
U4 = SD3934: 贴片IC：SD3934-QFN52L6*6; PCB DECAL: QFN52-0.4
U5 = P25Q64H-SUH-IT: Manufacturer: PUYA(普冉); Convert to PCB: yes; UniqueId: ggeec8bb7aad7322074; ModelId: fc9b9a2dc0bb4458871072ce0a00885d; ModelName: SOP-8_L5.2-W5.3-H2.1-LS7.9-P1.27; ModelTransform: v2:[2.410722045565656e-15,39.37007874015748,0,-39.37007874015748,2.410722045565656e-15,0,0,0,39.37007874015748,0,0,0]; Device: P25Q64H-SUH-IT; Supplier: LCSC; Supplier Part: C414065; Manufacturer Part: P25Q64H-SUH-IT; JLCPCB Part Class: Extended Part; Add into BOM: yes; SymbolName: P25Q64H-SUH-IT; FootprintName: SOP-8_L5.3-W5.3-P1.27-LS8.0-BL
U6 = SP1233FL: 贴片IC：SP1232F-SOP8
U7 U8 = SD59D31_QFN16: 贴片IC：SD59D31-QFN3x3_16; PCB DECAL: QFN16_3X3